# Altium schematic sheet Instr_pojacalo.SchDoc
size A4; SheetNumber: 2; SheetTotal: 4
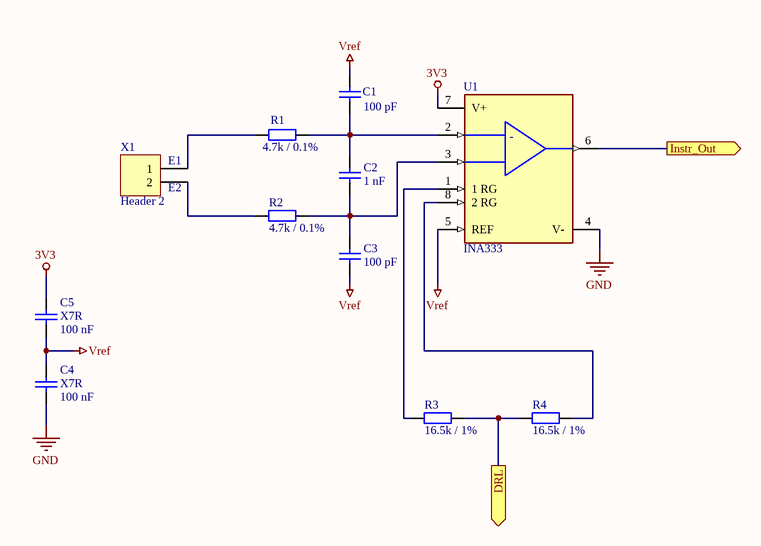
[diagram p0: Instr_pojacalo.SchDoc]

## Parts
C1  100 pF  [C0805]
C2  1 nF  [C0805]
C3  100 pF  [C0805]
C4  X7R  value 100 nF  [C0805]
C5  X7R  value 100 nF  [C0805]
R1  4.7k / 0.1%  [6-0805_N]
R2  4.7k / 0.1%  [6-0805_N]
R3  16.5k / 1%  [6-0805_N]
R4  16.5k / 1%  [6-0805_N]
U1  INA333  [FP-DGK0008A-MFG]
X1  Header 2  [HDR1X2]

## Ports
DRL (out, see Top[1B], PogonDesneNoge[1A]), Instr_Out (out, see Top[1B], AntiAliasing_Bessel[1B])

## Nets
3V3: C5.2 U1.7(V+)
GND: C4.1 U1.4(V-)
Vref: C1.2 C3.1 C4.2 C5.1 U1.5(REF)
DRL: R3.2 R4.1 ; port DRL
Instr_Out: U1.6(VOUT) ; port Instr_Out
NetC1_1: C1.1 C2.2 R1.2 U1.2(VIN-)
NetC2_1: C2.1 C3.2 R2.2 U1.3(VIN+)
NetR1_1: R1.1 X1.1
NetR2_1: R2.1 X1.2
NetR3_1: R3.1 U1.1(1_RG)
NetR4_2: R4.2 U1.8(2_RG)

## Notes on the sheet
- (near X1) E1
- (near X1) E2
- (in symbol CMP-0944-00090-3) -

## Library data of the parts
C1 C3 = Cap: Capacitor; Proizvođač: Murata Electronics; Kataloški broj: GRM2165C1H101JA01D; Cijena: 0,10 €; Kućište: 0805; Opis: Keramički kondenzator, 100 pF, 50V, C0G; Value: 100 pF
C2 = Cap: Capacitor; Proizvođač: Murata Electronics; Kataloški broj: GRM2165C1H102JA01D; Cijena: 0,13 €; Kućište: 0805; Opis: Keramički kondenzator, 1 nF, 50V, C0G; Value: 1 nF
C4 C5 = Cap: Capacitor; Proizvođač: Murata Electronics; Kataloški broj: GCM21BR71H104KA37L; Cijena: 0,28 €; Kućište: 0805; Opis: Keramički kondenzator, 100 nF, 50V, X7R
R1 R2 = Res2: Resistor; Proizvođač: Panasonic; Kataloški broj: ERA-6AEB472V; Cijena: 0,09 €; Kućište: 0805; Opis: Precizni otpornik, 4.7 k, 0.1%; Value: 4.7k / 0.1%
R3 R4 = Res2: Resistor; Proizvođač: Vishay; Kataloški broj: CRCW080516K5FKEA; Cijena: 0,09 €; Kućište: 0805; Opis: Otpornik, 16.5 k, 1%; Value: 16.5k / 1%
U1 = CMP-0944-00090-3: IC INST AMP 1 CIRCUIT 8VSSOP; Proizvođač: Texas Instruments; Kataloški broj: INA333AIDGKT; Cijena: 4,87 €; Kućište: VSSOP-8; Opis: Instrumentacijsko pojačalo
X1 = Header 2: Header, 2-Pin; Proizvođač: Molex; Kataloški broj: 90120-0122; Cijena: 0,34 €; Kućište: THT Pin Header 2.54mm; Opis: Muški konektor 1x2, 2.54mm